# Altium schematic sheet Top_Sheet.SchDoc
size A4; SheetNumber: 1; SheetTotal: 2
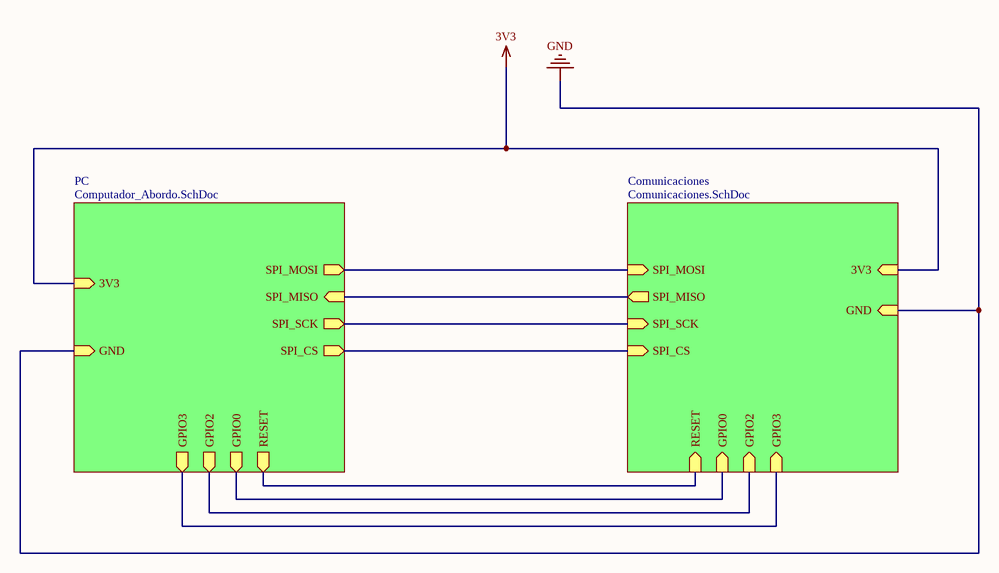
[diagram p0: Top_Sheet.SchDoc]

## Sub-sheets
Comunicaciones = Comunicaciones.SchDoc: SPI_MOSI (in), SPI_MISO (out), SPI_SCK (in), SPI_CS (in), RESET (in), GPIO0 (in), GPIO2 (in), GPIO3 (in), 3V3 (in), GND (in)
PC = Computador_Abordo.SchDoc: SPI_CS (out), SPI_SCK (out), SPI_MISO (in), SPI_MOSI (out), RESET (out), GPIO0 (out), GPIO2 (out), GPIO3 (out), 3V3 (in), GND (in)

## Nets
3V3: sheet PC/3V3, sheet Comunicaciones/3V3
GND: sheet PC/GND, sheet Comunicaciones/GND
(unnamed): sheet PC/SPI_CS, sheet Comunicaciones/SPI_CS
(unnamed): sheet PC/SPI_SCK, sheet Comunicaciones/SPI_SCK
(unnamed): sheet PC/SPI_MISO, sheet Comunicaciones/SPI_MISO
(unnamed): sheet PC/SPI_MOSI, sheet Comunicaciones/SPI_MOSI
(unnamed): sheet PC/RESET, sheet Comunicaciones/RESET
(unnamed): sheet PC/GPIO0, sheet Comunicaciones/GPIO0
(unnamed): sheet PC/GPIO2, sheet Comunicaciones/GPIO2
(unnamed): sheet PC/GPIO3, sheet Comunicaciones/GPIO3